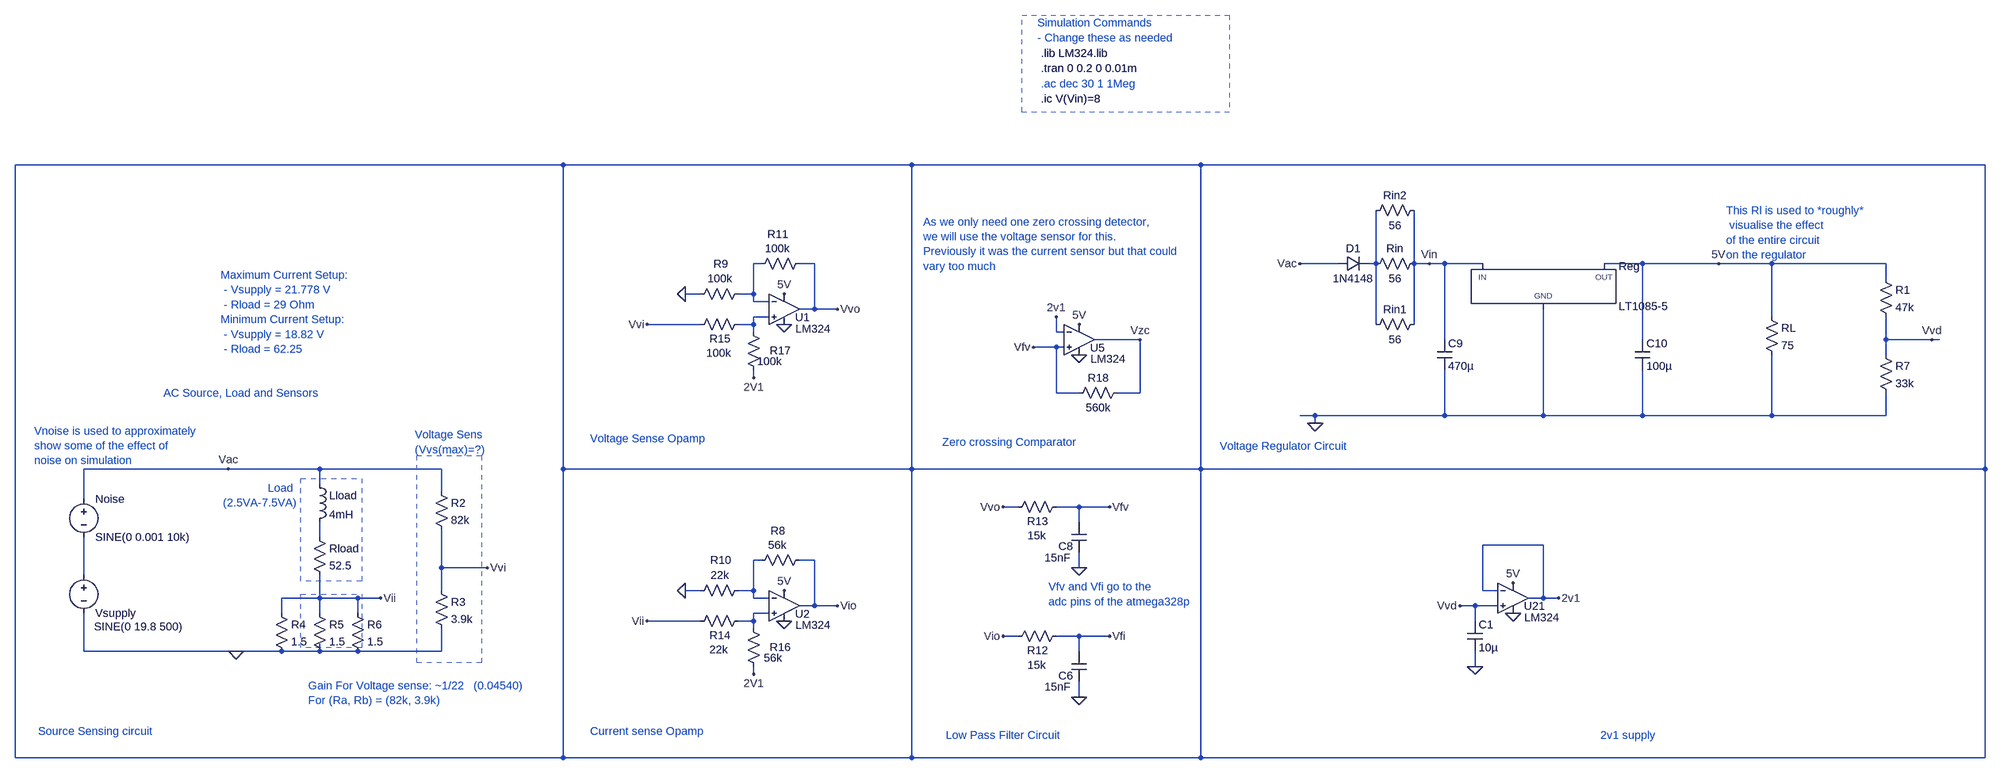
[diagram p0: schematic PowerSensSim.asc]
PowerSensSim.asc, the LTspice schematic file:
Version 4.1
SHEET 1 3752 2980
WIRE -368 464 -1520 464
WIRE 384 464 -368 464
WIRE 992 464 384 464
WIRE 2640 464 992 464
WIRE 48 672 32 672
WIRE 160 672 128 672
WIRE 1280 672 1200 672
WIRE 1360 672 1360 560
WIRE 1360 672 1344 672
WIRE 1440 672 1440 560
WIRE 1472 672 1440 672
WIRE 1504 672 1472 672
WIRE 1584 672 1504 672
WIRE 1920 672 1840 672
WIRE 2080 672 1920 672
WIRE 2192 672 2080 672
WIRE 2432 672 2192 672
WIRE 2432 704 2432 672
WIRE -80 736 -112 736
WIRE 32 736 32 672
WIRE 32 736 0 736
WIRE 32 752 32 736
WIRE 64 752 32 752
WIRE 160 768 160 672
WIRE 160 768 128 768
WIRE 208 768 160 768
WIRE 64 784 32 784
WIRE 2192 784 2192 672
WIRE -80 800 -192 800
WIRE 32 800 32 784
WIRE 32 800 0 800
WIRE 1360 800 1360 672
WIRE 1440 800 1440 672
WIRE 32 816 32 800
WIRE 688 816 688 784
WIRE 704 816 688 816
WIRE 864 832 768 832
WIRE 1504 832 1504 672
WIRE 1920 832 1920 672
WIRE 2432 832 2432 784
WIRE 2528 832 2432 832
WIRE 2544 832 2528 832
WIRE 688 848 640 848
WIRE 704 848 688 848
WIRE 2432 864 2432 832
WIRE 32 912 32 896
WIRE 688 944 688 848
WIRE 736 944 688 944
WIRE 864 944 864 832
WIRE 864 944 816 944
WIRE 1232 992 1200 992
WIRE 1504 992 1504 896
WIRE 1504 992 1232 992
WIRE 1712 992 1712 768
WIRE 1712 992 1504 992
WIRE 1920 992 1920 896
WIRE 1920 992 1712 992
WIRE 2192 992 2192 864
WIRE 2192 992 1920 992
WIRE 2432 992 2432 944
WIRE 2432 992 2192 992
WIRE 1232 1008 1232 992
WIRE -1072 1104 -1376 1104
WIRE -880 1104 -1072 1104
WIRE -624 1104 -880 1104
WIRE -368 1104 -368 464
WIRE 384 1104 384 464
WIRE 384 1104 -368 1104
WIRE 992 1104 992 464
WIRE 992 1104 384 1104
WIRE 2640 1104 2640 464
WIRE 2640 1104 992 1104
WIRE -880 1136 -880 1104
WIRE -624 1152 -624 1104
WIRE -1376 1168 -1376 1104
WIRE 608 1184 576 1184
WIRE 736 1184 688 1184
WIRE 800 1184 736 1184
WIRE 736 1216 736 1184
WIRE -880 1248 -880 1216
WIRE 1712 1264 1584 1264
WIRE 48 1296 32 1296
WIRE 160 1296 128 1296
WIRE -624 1312 -624 1232
WIRE -528 1312 -624 1312
WIRE 736 1312 736 1280
WIRE -1376 1328 -1376 1248
WIRE -624 1360 -624 1312
WIRE -80 1360 -112 1360
WIRE 32 1360 32 1296
WIRE 32 1360 0 1360
WIRE 1584 1360 1584 1264
WIRE 1616 1360 1584 1360
WIRE -880 1376 -880 1328
WIRE -880 1376 -960 1376
WIRE -800 1376 -880 1376
WIRE -752 1376 -800 1376
WIRE 32 1376 32 1360
WIRE 64 1376 32 1376
WIRE 1712 1376 1712 1264
WIRE 1712 1376 1680 1376
WIRE 1744 1376 1712 1376
WIRE 160 1392 160 1296
WIRE 160 1392 128 1392
WIRE 208 1392 160 1392
WIRE 1568 1392 1536 1392
WIRE 1616 1392 1568 1392
WIRE -960 1408 -960 1376
WIRE -880 1408 -880 1376
WIRE -800 1408 -800 1376
WIRE 64 1408 32 1408
WIRE -80 1424 -192 1424
WIRE 32 1424 32 1408
WIRE 32 1424 0 1424
WIRE 1568 1424 1568 1392
WIRE 32 1440 32 1424
WIRE 608 1456 576 1456
WIRE 736 1456 688 1456
WIRE 800 1456 736 1456
WIRE -1376 1488 -1376 1408
WIRE -1056 1488 -1376 1488
WIRE -960 1488 -1056 1488
WIRE -880 1488 -880 1472
WIRE -880 1488 -960 1488
WIRE -800 1488 -880 1488
WIRE -624 1488 -624 1440
WIRE -624 1488 -800 1488
WIRE 736 1488 736 1456
WIRE 1568 1520 1568 1488
WIRE 32 1536 32 1520
WIRE 736 1584 736 1552
WIRE -1520 1712 -1520 464
WIRE -368 1712 -368 1104
WIRE -368 1712 -1520 1712
WIRE 384 1712 384 1104
WIRE 384 1712 -368 1712
WIRE 992 1712 992 1104
WIRE 992 1712 384 1712
WIRE 2640 1712 2640 1104
WIRE 2640 1712 992 1712
FLAG -1056 1488 0
FLAG -1072 1104 Vac
FLAG 1232 1008 0
FLAG 96 1424 0
FLAG 96 1360 5V
FLAG -112 1360 0
FLAG 32 1536 2V1
FLAG 96 800 0
FLAG 96 736 5V
FLAG -112 736 0
FLAG 32 912 2V1
FLAG 1200 672 Vac
FLAG 2080 672 5V
FLAG 736 1584 0
FLAG 800 1456 Vfi
FLAG 1472 672 Vin
FLAG 736 1312 0
FLAG 800 1184 Vfv
FLAG 1744 1376 2v1
FLAG 576 1456 Vio
FLAG 576 1184 Vvo
FLAG -192 1424 Vii
FLAG -192 800 Vvi
FLAG 1648 1408 0
FLAG 1648 1344 5V
FLAG 736 800 5V
FLAG 736 864 0
FLAG 864 832 Vzc
FLAG 688 784 2v1
FLAG -528 1312 Vvi
FLAG -752 1376 Vii
FLAG 208 768 Vvo
FLAG 208 1392 Vio
FLAG 1568 1520 0
FLAG 1536 1392 Vvd
FLAG 2528 832 Vvd
FLAG 640 848 Vfv
SYMBOL voltage -1376 1312 R0
WINDOW 0 24 96 Left 2
WINDOW 3 22 124 Left 2
WINDOW 123 0 0 Left 0
WINDOW 39 0 0 Left 0
SYMATTR InstName Vsupply
SYMATTR Value SINE(0 19.8 500)
SYMBOL PowerProducts/LT1085-5 1712 672 R0
SYMATTR InstName Reg
SYMBOL res 2176 768 R0
SYMATTR InstName RL
SYMATTR Value 75
SYMBOL res 1456 656 R90
WINDOW 0 0 56 VBottom 2
WINDOW 3 32 56 VTop 2
SYMATTR InstName Rin
SYMATTR Value 56
SYMBOL diode 1280 688 R270
WINDOW 0 32 32 VTop 2
WINDOW 3 0 32 VBottom 2
SYMATTR InstName D1
SYMATTR Value 1N4148
SYMBOL cap 1488 832 R0
SYMATTR InstName C9
SYMATTR Value 470µ
SYMATTR SpiceLine Rser=0.001
SYMBOL cap 1904 832 R0
SYMATTR InstName C10
SYMATTR Value 100µ
SYMATTR SpiceLine Rser=0.001
SYMBOL res -896 1232 R0
SYMATTR InstName Rload
SYMATTR Value 52.5
SYMBOL ind -896 1120 R0
SYMATTR InstName Lload
SYMATTR Value 4mH
SYMBOL res -640 1136 R0
SYMATTR InstName R2
SYMATTR Value 82k
SYMBOL res -640 1344 R0
SYMATTR InstName R3
SYMATTR Value 3.9k
SYMBOL Opamps/opamp2 1648 1312 R0
WINDOW 0 23 81 Left 2
WINDOW 3 24 105 Left 2
SYMATTR InstName U21
SYMATTR Value LM324
SYMBOL res 16 1408 R90
WINDOW 0 62 55 VBottom 2
WINDOW 3 61 57 VTop 2
SYMATTR InstName R14
SYMATTR Value 22k
SYMBOL res 16 1344 R90
WINDOW 0 -32 53 VBottom 2
WINDOW 3 -32 55 VTop 2
SYMATTR InstName R10
SYMATTR Value 22k
SYMBOL res 144 1280 R90
WINDOW 0 -30 61 VBottom 2
WINDOW 3 -31 62 VTop 2
SYMATTR InstName R8
SYMATTR Value 56k
SYMBOL res 48 1536 R180
WINDOW 0 -62 57 Left 2
WINDOW 3 -44 34 Left 2
SYMATTR InstName R16
SYMATTR Value 56k
SYMBOL Opamps/opamp2 96 704 R0
WINDOW 0 23 81 Left 2
WINDOW 3 24 105 Left 2
SYMATTR InstName U1
SYMATTR Value LM324
SYMBOL res 16 784 R90
WINDOW 0 62 55 VBottom 2
WINDOW 3 61 57 VTop 2
SYMATTR InstName R15
SYMATTR Value 100k
SYMBOL res 16 720 R90
WINDOW 0 -32 53 VBottom 2
WINDOW 3 -32 55 VTop 2
SYMATTR InstName R9
SYMATTR Value 100k
SYMBOL res 144 656 R90
WINDOW 0 -30 61 VBottom 2
WINDOW 3 -31 62 VTop 2
SYMATTR InstName R11
SYMATTR Value 100k
SYMBOL res 48 912 R180
WINDOW 0 -62 57 Left 2
WINDOW 3 -44 34 Left 2
SYMATTR InstName R17
SYMATTR Value 100k
SYMBOL res 704 1440 R90
WINDOW 0 62 55 VBottom 2
WINDOW 3 61 57 VTop 2
SYMATTR InstName R12
SYMATTR Value 15k
SYMBOL cap 752 1552 R180
WINDOW 0 29 13 Left 2
WINDOW 3 33 -11 Left 2
SYMATTR InstName C6
SYMATTR Value 15nF
SYMBOL res 2416 848 R0
SYMATTR InstName R7
SYMATTR Value 33k
SYMBOL res 2416 688 R0
SYMATTR InstName R1
SYMATTR Value 47k
SYMBOL cap 1552 1424 R0
SYMATTR InstName C1
SYMATTR Value 10µ
SYMBOL res 704 1168 R90
WINDOW 0 62 55 VBottom 2
WINDOW 3 61 57 VTop 2
SYMATTR InstName R13
SYMATTR Value 15k
SYMBOL cap 752 1280 R180
WINDOW 0 29 13 Left 2
WINDOW 3 33 -11 Left 2
SYMATTR InstName C8
SYMATTR Value 15nF
SYMBOL Opamps/opamp2 96 1328 R0
WINDOW 0 23 81 Left 2
WINDOW 3 24 105 Left 2
SYMATTR InstName U2
SYMATTR Value LM324
SYMBOL voltage -1376 1152 R0
WINDOW 123 0 0 Left 0
WINDOW 39 0 0 Left 0
SYMATTR InstName Noise
SYMATTR Value SINE(0 0.001 10k)
SYMBOL Opamps/opamp2 736 768 R0
WINDOW 0 23 81 Left 2
WINDOW 3 24 105 Left 2
SYMATTR InstName U5
SYMATTR Value LM324
SYMBOL res 1456 544 R90
WINDOW 0 0 56 VBottom 2
WINDOW 3 32 56 VTop 2
SYMATTR InstName Rin2
SYMATTR Value 56
SYMBOL res -816 1392 R0
SYMATTR InstName R6
SYMATTR Value 1.5
SYMBOL res -896 1392 R0
SYMATTR InstName R5
SYMATTR Value 1.5
SYMBOL res -976 1392 R0
SYMATTR InstName R4
SYMATTR Value 1.5
SYMBOL res 1456 784 R90
WINDOW 0 0 56 VBottom 2
WINDOW 3 32 56 VTop 2
SYMATTR InstName Rin1
SYMATTR Value 56
SYMBOL res 832 928 R90
WINDOW 0 0 56 VBottom 2
WINDOW 3 32 56 VTop 2
SYMATTR InstName R18
SYMATTR Value 560k
TEXT 656 -80 Left 2 ;.ac dec 30 1 1Meg
TEXT 656 -144 Left 2 !.lib LM324.lib
TEXT -1208 944 Left 2 ;AC Source, Load and Sensors
TEXT -1472 1656 Left 2 ;Source Sensing circuit
TEXT -928 1144 Right 2 ;Load \n(2.5VA-7.5VA)
TEXT -680 1032 Left 2 ;Voltage Sens\n(Vvs(max)=?)
TEXT 648 -208 Left 2 ;Simulation Commands\n- Change these as needed
TEXT -312 1656 Left 2 ;Current sense Opamp
TEXT -312 1040 Left 2 ;Voltage Sense Opamp
TEXT 656 -112 Left 2 !.tran 0 0.2 0 0.01m
TEXT 656 -48 Left 2 !.ic V(Vin)=8
TEXT 1032 1056 Left 2 ;Voltage Regulator Circuit
TEXT 456 1664 Left 2 ;Low Pass Filter Circuit
TEXT -1088 696 Left 2 ;Maximum Current Setup:\n - Vsupply = 21.778 V\n - Rload = 29 Ohm\nMinimum Current Setup:\n - Vsupply = 18.82 V\n - Rload = 62.25
TEXT 448 1048 Left 2 ;Zero crossing Comparator
TEXT 408 584 Left 2 ;As we only need one zero crossing detector,\nwe will use the voltage sensor for this.\nPreviously it was the current sensor but that could \nvary too much
TEXT 1832 1664 Left 2 ;2v1 supply
TEXT -904 1560 Left 2 ;Gain For Voltage sense: ~1/22   (0.04540)\nFor (Ra, Rb) = (82k, 3.9k)
TEXT 2096 560 Left 2 ;This Rl is used to *roughly*\n visualise the effect \nof the entire circuit\non the regulator
TEXT -1480 1024 Left 2 ;Vnoise is used to approximately \nshow some of the effect of \nnoise on simulation
TEXT 672 1352 Left 2 ;Vfv and Vfi go to the \nadc pins of the atmega328p
RECTANGLE Normal -920 1124 -792 1340 2
RECTANGLE Normal -920 1368 -792 1480 2
RECTANGLE Normal -676 1076 -540 1512 2
RECTANGLE Normal 616 -224 1052 -20 2

The netlist it stands for:
* PowerSensSim.asc
Vsupply N007 0 SINE(0 19.8 500)
X§Reg 0 5V Vin LT1085-5  ; pins GND OUT IN
RL 5V 0 75
Rin Vin N003 56
D1 Vac N003 1N4148
C9 Vin 0 470µ Rser=0.001
C10 5V 0 100µ Rser=0.001
Rload N005 Vii 52.5
Lload Vac N005 4mH
R2 Vac Vvi 82k
R3 Vvi 0 3.9k
X§U21 Vvd 2V1 5V 0 2V1 LM324  ; pins In+ In- V+ V- OUT
R14 N008 Vii 22k
R10 N006 0 22k
R8 Vio N006 56k
R16 2V1 N008 56k
X§U1 N004 N002 5V 0 Vvo LM324  ; pins In+ In- V+ V- OUT
R15 N004 Vvi 100k
R9 N002 0 100k
R11 Vvo N002 100k
R17 2V1 N004 100k
R12 Vfi Vio 15k
C6 0 Vfi 15nF
R7 Vvd 0 33k
R1 5V Vvd 47k
C1 Vvd 0 10µ
R13 Vfv Vvo 15k
C8 0 Vfv 15nF
X§U2 N008 N006 5V 0 Vio LM324  ; pins In+ In- V+ V- OUT
V§Noise Vac N007 SINE(0 0.001 10k)
X§U5 Vfv 2V1 5V 0 Vzc LM324  ; pins In+ In- V+ V- OUT
Rin2 Vin N003 56
R6 Vii 0 1.5
R5 Vii 0 1.5
R4 Vii 0 1.5
Rin1 Vin N003 56
R18 Vzc Vfv 560k
.model D D
.lib standard.dio
* .ac dec 30 1 1Meg
.lib LM324.lib
* AC Source, Load and Sensors
* Source Sensing circuit
* Load
* (2.5VA-7.5VA)
* Voltage Sens
* (Vvs(max)=?)
* Simulation Commands
* - Change these as needed
* Current sense Opamp
* Voltage Sense Opamp
.tran 0 0.2 0 0.01m
.ic V(Vin)=8
* Voltage Regulator Circuit
* Low Pass Filter Circuit
* Maximum Current Setup:
*  - Vsupply = 21.778 V
*  - Rload = 29 Ohm
* Minimum Current Setup:
*  - Vsupply = 18.82 V
*  - Rload = 62.25
* Zero crossing Comparator
* As we only need one zero crossing detector,
* we will use the voltage sensor for this.
* Previously it was the current sensor but that could
* vary too much
* 2v1 supply
* Gain For Voltage sense: ~1/22   (0.04540)
* For (Ra, Rb) = (82k, 3.9k)
* This Rl is used to *roughly*
*  visualise the effect
* of the entire circuit
* on the regulator
* Vnoise is used to approximately
* show some of the effect of
* noise on simulation
* Vfv and Vfi go to the
* adc pins of the atmega328p
.backanno
.end